# EasyEDA Pro project ProPrj_CactusConKids14_2026-02-14.epro, board PCB4
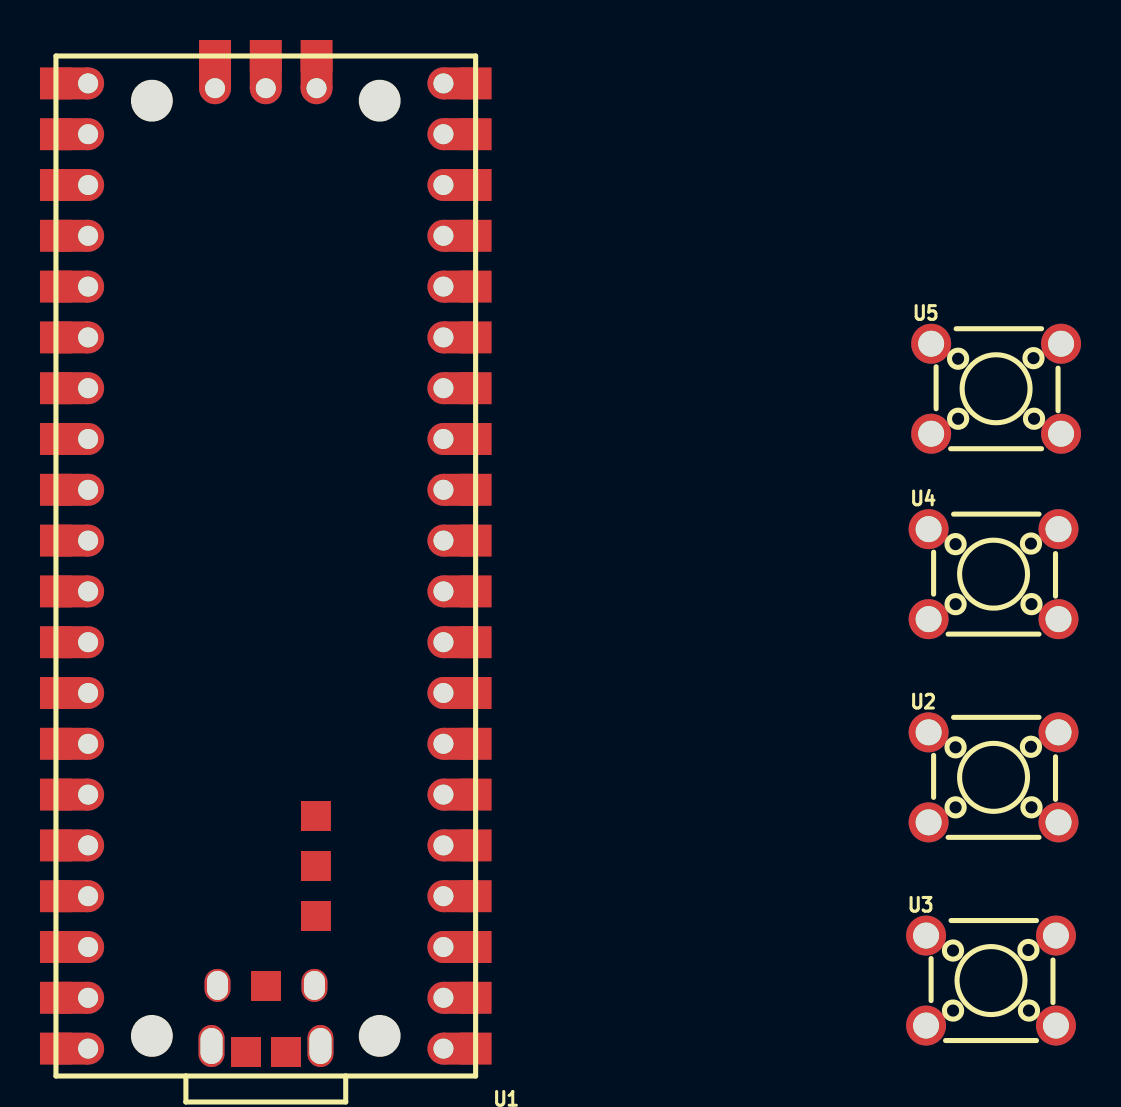
[diagram p7: board, top side]
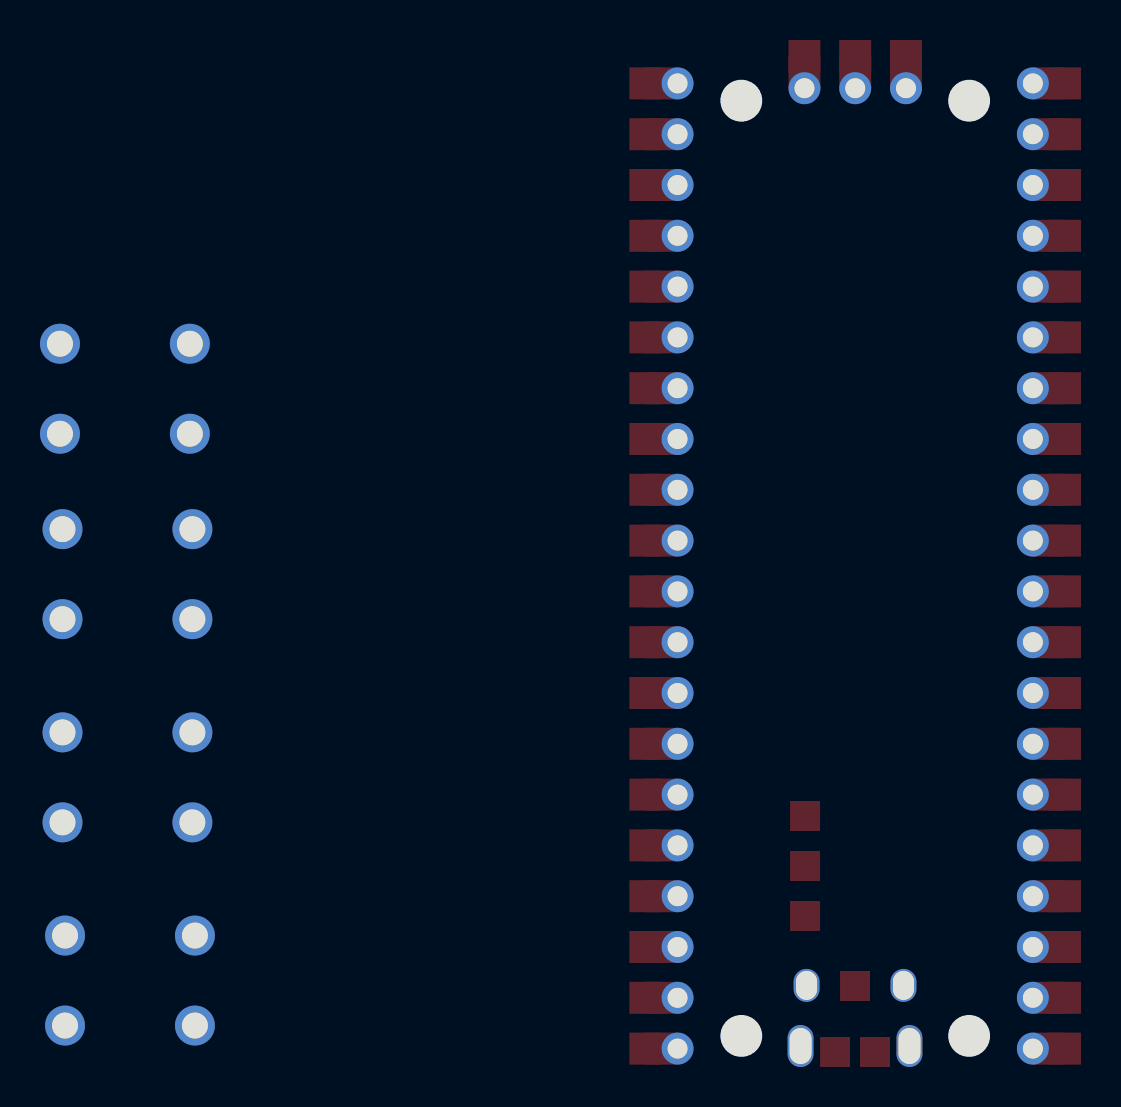
[diagram p8: board, bottom side, seen from below]

Outline 13.49 x 48.85 mm; copper layers: Top Layer, Bottom Layer. Coordinates in mm from the lower left corner of the outline.
Stack: Top Layer 0.035mm / Dielectric1 1.51mm FR4 er 4.5 / Bottom Layer 0.035mm

## Design rules (mm)
template: JLCPCB Capability(Two Layers Board)
spacing copperThickness1oz (default): track to track 0.102, other pairs 0.152 to 0.3
spacing copperThickness2oz: track to track 0.203, other pairs 0.152 to 0.3
track width copperThickness1oz (default): min 0.127, default 0.254, max 2.54
track width copperThickness2oz: min 0.203, default 0.254, max 2.54
differential pair differentialPair (default): width min 0.127, default 0.254, max 2.54; gap min 0.152, default 0.152
via viaSize (default): diameter min 0.5, default 0.61, max 10; hole min 0.3, default 0.305, max 6.3

## Placement (name value [footprint] x y rotation side)
U1  -  [RASPBERRY PI PICO]  17.25 50.04 180 top
U2  1301.9302  [KEY-TH_4P-L6.0-W6.0-P4.50-LS6.50]  43.16 13.97 0 top
U3  1301.9302  [KEY-TH_4P-L6.0-W6.0-P4.50-LS6.50]  43.04 3.81 0 top
U4  1301.9302  [KEY-TH_4P-L6.0-W6.0-P4.50-LS6.50]  43.16 24.13 0 top
U5  1301.9302  [KEY-TH_4P-L6.0-W6.0-P4.50-LS6.50]  43.29 33.4 0 top

## Footprints (pads in the part's own frame, mm; a bottom-side part is the same pattern mirrored in y, then rotated)
KEY-TH_4P-L6.0-W6.0-P4.50-LS6.50
  round 2 hole 1.3: 1(-3.25,2.25) 2(3.25,2.25) 3(-3.25,-2.25) 4(3.25,-2.25)
RASPBERRY PI PICO
  rect 1.6x1.6 smd: 1(0.01,49.63) 1(0.815,49.63) 2(0.01,47.09) 2(0.815,47.09) 3(0.01,44.55) 3(0.815,44.55) 4(0.01,42.01) 4(0.815,42.01) 5(0.01,39.47) 5(0.815,39.47) 6(0.01,36.93) 6(0.815,36.93) 7(0.01,34.39) 7(0.815,34.39) 8(0.01,31.85) 8(0.815,31.85) 9(0.01,29.31) 9(0.815,29.31) 10(0.01,26.77) 10(0.815,26.77) 11(0.01,24.23) 11(0.815,24.23) 12(0.01,21.69) 12(0.815,21.69) 13(0.01,19.15) 13(0.815,19.15) 14(0.01,16.61) 14(0.815,16.61) 15(0.01,14.07) 15(0.815,14.07) 16(0.01,11.53) 16(0.815,11.53) 17(0.01,8.99) 17(0.815,8.99) 18(0.01,6.45) 18(0.815,6.45) 19(0.01,3.91) 19(0.815,3.91) 20(0.01,1.37) 20(0.815,1.37) 21(20.205,1.37) 21(21.01,1.37) 22(20.205,3.91) 22(21.01,3.91) 23(20.205,6.45) 23(21.01,6.45) 24(20.205,8.99) 24(21.01,8.99) 25(20.205,11.53) 25(21.01,11.53) 26(20.205,14.07) 26(21.01,14.07) 27(20.205,16.61) 27(21.01,16.61) 28(20.205,19.15) 28(21.01,19.15) 29(20.205,21.69) 29(21.01,21.69) 30(20.205,24.23) 30(21.01,24.23) 31(20.205,26.77) 31(21.01,26.77) 32(20.205,29.31) 32(21.01,29.31) 33(20.205,31.85) 33(21.01,31.85) 34(20.205,34.39) 34(21.01,34.39) 35(20.205,36.93) 35(21.01,36.93) 36(20.205,39.47) 36(21.01,39.47) 37(20.205,42.01) 37(21.01,42.01) 38(20.205,44.55) 38(21.01,44.55) 39(20.205,47.09) 39(21.01,47.09) 40(20.205,49.63) 40(21.01,49.63) 41(7.97,0.805) 41(7.97,0) 42(10.51,0.805) 42(10.51,0) 43(13.05,0.805) 43(13.05,0)
  round 1.6 hole 1: 1(1.62,49.63) 2(1.62,47.09) 3(1.62,44.55) 4(1.62,42.01) 5(1.62,39.47) 6(1.62,36.93) 7(1.62,34.39) 8(1.62,31.85) 9(1.62,29.31) 10(1.62,26.77) 11(1.62,24.23) 12(1.62,21.69) 13(1.62,19.15) 14(1.62,16.61) 15(1.62,14.07) 16(1.62,11.53) 17(1.62,8.99) 18(1.62,6.45) 19(1.62,3.91) 20(1.62,1.37) 21(19.4,1.37) 22(19.4,3.91) 23(19.4,6.45) 24(19.4,8.99) 25(19.4,11.53) 26(19.4,14.07) 27(19.4,16.61) 28(19.4,19.15) 29(19.4,21.69) 30(19.4,24.23) 31(19.4,26.77) 32(19.4,29.31) 33(19.4,31.85) 34(19.4,34.39) 35(19.4,36.93) 36(19.4,39.47) 37(19.4,42.01) 38(19.4,44.55) 39(19.4,47.09) 40(19.4,49.63) 41(7.97,1.61) 42(10.51,1.61) 43(13.05,1.61)
  rect 1.5x1.5 smd: 44(10.5,46.5) 45(9.5,49.8) 46(11.5,49.8) 47(8,43) 48(8,40.5) 49(8,38)
  oval 1.3x2.1 hole 1.1x1.8: 50(7.775,49.5) 50(13.225,49.5)
  oval 1.3x1.65 hole 1.05x1.45: 50(8.075,46.47) 50(12.925,46.47)

## Nets
GND: U2.3 U3.3 U4.3 U5.3
$1N698: U1.4 U5.2
$1N704: U1.5 U4.2
$1N711: U1.6 U2.2
$1N721: U1.7 U3.2

Pads without a net: U1 1 2 3 8 9 10 11 12 13 14 15 16 17 18 19 20 21 22 23 24 25 26 27 28 29 30 31 32 33 34 35 36 37 38 39 40 41 42 43 44 45 46 47 48 49 50; U2 1 4; U3 1 4; U4 1 4; U5 1 4
